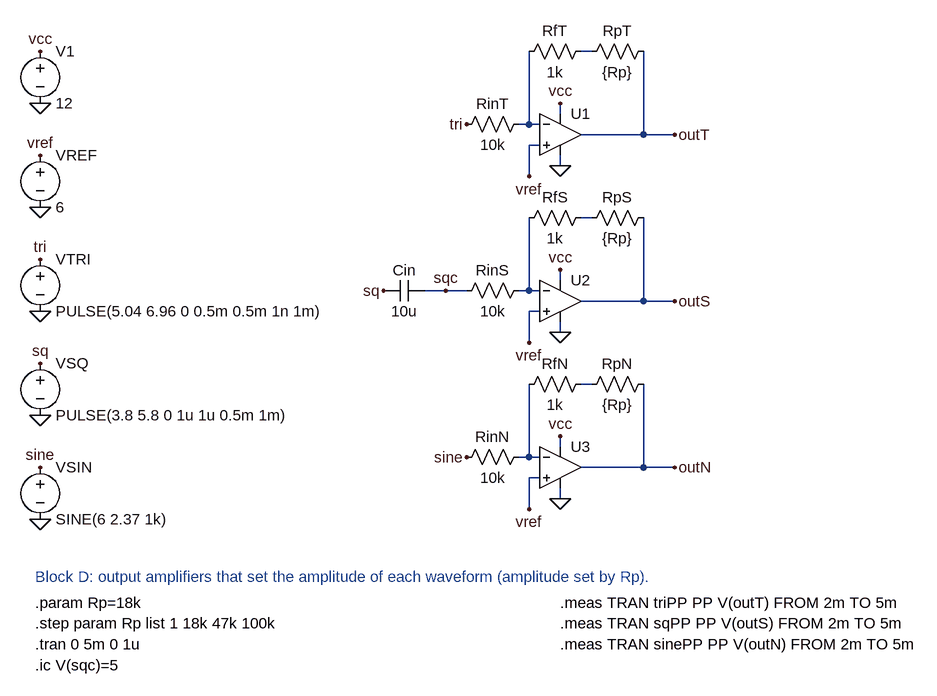
[diagram p0: schematic blockD.asc]
blockD.asc, the LTspice schematic file:
Version 4
SHEET 1 1400 960
WIRE 0 32 0 16
WIRE 0 96 0 112
WIRE -32 80 -48 80
WIRE -48 80 -48 128
WIRE -64 48 -48 48
WIRE -48 48 -32 48
WIRE -48 48 -48 -64
WIRE 32 -64 48 -64
WIRE 128 -64 128 64
WIRE 32 64 128 64
WIRE 128 64 176 64
WIRE 0 288 0 272
WIRE 0 352 0 368
WIRE -32 336 -48 336
WIRE -48 336 -48 384
WIRE -64 304 -48 304
WIRE -48 304 -32 304
WIRE -48 304 -48 192
WIRE 32 192 48 192
WIRE 128 192 128 320
WIRE 32 320 128 320
WIRE 128 320 176 320
WIRE -208 304 -176 304
WIRE -176 304 -144 304
WIRE 0 544 0 528
WIRE 0 608 0 624
WIRE -32 592 -48 592
WIRE -48 592 -48 640
WIRE -64 560 -48 560
WIRE -48 560 -32 560
WIRE -48 560 -48 448
WIRE 32 448 48 448
WIRE 128 448 128 576
WIRE 32 576 128 576
WIRE 128 576 176 576
FLAG -800 -64 vcc
FLAG -800 16 0
FLAG -800 96 vref
FLAG -800 176 0
FLAG -800 256 tri
FLAG -800 336 0
FLAG -800 416 sq
FLAG -800 496 0
FLAG -800 576 sine
FLAG -800 656 0
FLAG 0 16 vcc
FLAG 0 112 0
FLAG -48 128 vref
FLAG 176 64 outT
FLAG -144 48 tri
FLAG 0 272 vcc
FLAG 0 368 0
FLAG -48 384 vref
FLAG 176 320 outS
FLAG -176 304 sqc
FLAG -272 304 sq
FLAG 0 528 vcc
FLAG 0 624 0
FLAG -48 640 vref
FLAG 176 576 outN
FLAG -144 560 sine
SYMBOL voltage -800 -80 R0
WINDOW 123 0 0 Left 0
WINDOW 39 0 0 Left 0
SYMATTR InstName V1
SYMATTR Value 12
SYMBOL voltage -800 80 R0
WINDOW 123 0 0 Left 0
WINDOW 39 0 0 Left 0
SYMATTR InstName VREF
SYMATTR Value 6
SYMBOL voltage -800 240 R0
WINDOW 123 0 0 Left 0
WINDOW 39 0 0 Left 0
SYMATTR InstName VTRI
SYMATTR Value PULSE(5.04 6.96 0 0.5m 0.5m 1n 1m)
SYMBOL voltage -800 400 R0
WINDOW 123 0 0 Left 0
WINDOW 39 0 0 Left 0
SYMATTR InstName VSQ
SYMATTR Value PULSE(3.8 5.8 0 1u 1u 0.5m 1m)
SYMBOL voltage -800 560 R0
WINDOW 123 0 0 Left 0
WINDOW 39 0 0 Left 0
SYMATTR InstName VSIN
SYMATTR Value SINE(6 2.37 1k)
SYMBOL res -48 32 R90
WINDOW 0 0 56 VBottom 2
WINDOW 3 32 56 VTop 2
SYMATTR InstName RinT
SYMATTR Value 10k
SYMBOL res 48 -80 R90
WINDOW 0 0 56 VBottom 2
WINDOW 3 32 56 VTop 2
SYMATTR InstName RfT
SYMATTR Value 1k
SYMBOL res 144 -80 R90
WINDOW 0 0 56 VBottom 2
WINDOW 3 32 56 VTop 2
SYMATTR InstName RpT
SYMATTR Value {Rp}
SYMBOL OpAmps\\UniversalOpAmp2 0 64 R0
SYMATTR InstName U1
SYMATTR Value2 Avol=200k GBW=3Meg Slew=13Meg
SYMATTR SpiceLine ilimit=25m rail=1.5 Vos=0 phimargin=45 en=0 enk=0 in=0 ink=0 Rin=1T
SYMBOL res -48 288 R90
WINDOW 0 0 56 VBottom 2
WINDOW 3 32 56 VTop 2
SYMATTR InstName RinS
SYMATTR Value 10k
SYMBOL res 48 176 R90
WINDOW 0 0 56 VBottom 2
WINDOW 3 32 56 VTop 2
SYMATTR InstName RfS
SYMATTR Value 1k
SYMBOL res 144 176 R90
WINDOW 0 0 56 VBottom 2
WINDOW 3 32 56 VTop 2
SYMATTR InstName RpS
SYMATTR Value {Rp}
SYMBOL OpAmps\\UniversalOpAmp2 0 320 R0
SYMATTR InstName U2
SYMATTR Value2 Avol=200k GBW=3Meg Slew=13Meg
SYMATTR SpiceLine ilimit=25m rail=1.5 Vos=0 phimargin=45 en=0 enk=0 in=0 ink=0 Rin=1T
SYMBOL cap -208 288 R90
WINDOW 0 0 32 VBottom 2
WINDOW 3 32 32 VTop 2
SYMATTR InstName Cin
SYMATTR Value 10u
SYMBOL res -48 544 R90
WINDOW 0 0 56 VBottom 2
WINDOW 3 32 56 VTop 2
SYMATTR InstName RinN
SYMATTR Value 10k
SYMBOL res 48 432 R90
WINDOW 0 0 56 VBottom 2
WINDOW 3 32 56 VTop 2
SYMATTR InstName RfN
SYMATTR Value 1k
SYMBOL res 144 432 R90
WINDOW 0 0 56 VBottom 2
WINDOW 3 32 56 VTop 2
SYMATTR InstName RpN
SYMATTR Value {Rp}
SYMBOL OpAmps\\UniversalOpAmp2 0 576 R0
SYMATTR InstName U3
SYMATTR Value2 Avol=200k GBW=3Meg Slew=13Meg
SYMATTR SpiceLine ilimit=25m rail=1.5 Vos=0 phimargin=45 en=0 enk=0 in=0 ink=0 Rin=1T
TEXT -808 744 Left 2 ;Block D: output amplifiers that set the amplitude of each waveform (amplitude set by Rp).
TEXT -808 784 Left 2 !.param Rp=18k
TEXT -808 816 Left 2 !.step param Rp list 1 18k 47k 100k
TEXT -808 848 Left 2 !.tran 0 5m 0 1u
TEXT -808 880 Left 2 !.ic V(sqc)=5
TEXT 0 784 Left 2 !.meas TRAN triPP PP V(outT) FROM 2m TO 5m
TEXT 0 816 Left 2 !.meas TRAN sqPP PP V(outS) FROM 2m TO 5m
TEXT 0 848 Left 2 !.meas TRAN sinePP PP V(outN) FROM 2m TO 5m

The netlist it stands for:
* blockD.asc
V1 vcc 0 12
VREF vref 0 6
VTRI tri 0 PULSE(5.04 6.96 0 0.5m 0.5m 1n 1m)
VSQ sq 0 PULSE(3.8 5.8 0 1u 1u 0.5m 1m)
VSIN sine 0 SINE(6 2.37 1k)
RinT N001 tri 10k
RfT N002 N001 1k
RpT outT N002 {Rp}
XU1 vref N001 vcc 0 outT level2 Avol=200k GBW=3Meg Slew=13Meg ilimit=25m rail=1.5 Vos=0 phimargin=45 en=0 enk=0 in=0 ink=0 Rin=1T En=0 Enk=0 In=0 Ink=0 Rin=500Meg  ; pins In+ In- V+ V- OUT
RinS N003 sqc 10k
RfS N004 N003 1k
RpS outS N004 {Rp}
XU2 vref N003 vcc 0 outS level2 Avol=200k GBW=3Meg Slew=13Meg ilimit=25m rail=1.5 Vos=0 phimargin=45 en=0 enk=0 in=0 ink=0 Rin=1T En=0 Enk=0 In=0 Ink=0 Rin=500Meg  ; pins In+ In- V+ V- OUT
Cin sqc sq 10u
RinN N005 sine 10k
RfN N006 N005 1k
RpN outN N006 {Rp}
XU3 vref N005 vcc 0 outN level2 Avol=200k GBW=3Meg Slew=13Meg ilimit=25m rail=1.5 Vos=0 phimargin=45 en=0 enk=0 in=0 ink=0 Rin=1T En=0 Enk=0 In=0 Ink=0 Rin=500Meg  ; pins In+ In- V+ V- OUT
* Block D: output amplifiers that set the amplitude of each waveform (amplitude set by Rp).
.param Rp=18k
.step param Rp list 1 18k 47k 100k
.tran 0 5m 0 1u
.ic V(sqc)=5
.meas TRAN triPP PP V(outT) FROM 2m TO 5m
.meas TRAN sqPP PP V(outS) FROM 2m TO 5m
.meas TRAN sinePP PP V(outN) FROM 2m TO 5m
.lib UniversalOpAmp2.lib
.backanno
.end